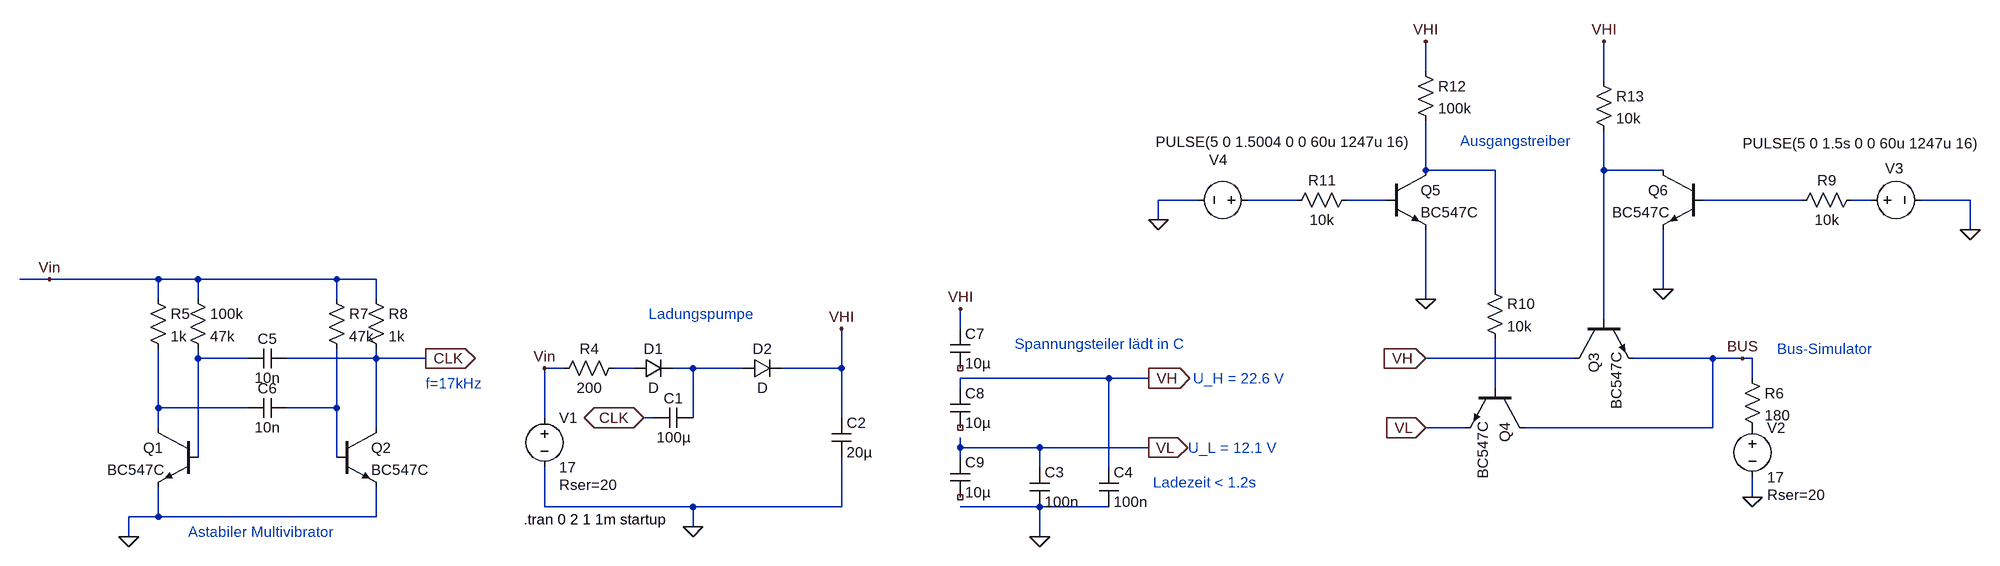
[diagram p0: schematic Drive2r.asc]
Drive2r.asc, the LTspice schematic file:
Version 4
SHEET 1 2516 820
WIRE 1456 -416 1456 -464
WIRE 1744 -400 1744 -464
WIRE 1456 -256 1456 -336
WIRE 1568 -256 1456 -256
WIRE 1744 -256 1744 -320
WIRE 1840 -256 1744 -256
WIRE 1088 -208 1024 -208
WIRE 1248 -208 1168 -208
WIRE 1392 -208 1328 -208
WIRE 2064 -208 1904 -208
WIRE 2176 -208 2144 -208
WIRE 2336 -208 2256 -208
WIRE 1024 -176 1024 -208
WIRE 2336 -160 2336 -208
WIRE -768 -80 -816 -80
WIRE -592 -80 -768 -80
WIRE -528 -80 -592 -80
WIRE -304 -80 -528 -80
WIRE -240 -80 -304 -80
WIRE 1568 -64 1568 -256
WIRE 1840 -64 1840 -160
WIRE -592 -48 -592 -80
WIRE -528 -48 -528 -80
WIRE -304 -48 -304 -80
WIRE -240 -48 -240 -80
WIRE 1456 -48 1456 -160
WIRE 1744 -16 1744 -256
WIRE 704 0 704 -32
WIRE -528 48 -528 32
WIRE -448 48 -528 48
WIRE -240 48 -240 32
WIRE -240 48 -384 48
WIRE -160 48 -240 48
WIRE 1696 48 1456 48
WIRE 1920 48 1792 48
WIRE 1968 48 1920 48
WIRE 1984 48 1968 48
WIRE 64 64 32 64
WIRE 176 64 144 64
WIRE 272 64 240 64
WIRE 352 64 272 64
WIRE 512 64 512 0
WIRE 512 64 416 64
WIRE 944 80 704 80
WIRE 1008 80 944 80
WIRE 1984 80 1984 48
WIRE 704 96 704 80
WIRE 1568 96 1568 16
WIRE -592 128 -592 32
WIRE -448 128 -592 128
WIRE -304 128 -304 32
WIRE -304 128 -384 128
WIRE 32 144 32 64
WIRE 208 144 192 144
WIRE 272 144 272 64
WIRE 512 144 512 64
WIRE -592 160 -592 128
WIRE -240 160 -240 48
WIRE 1520 160 1456 160
WIRE 1920 160 1920 48
WIRE 1920 160 1616 160
WIRE 704 192 704 176
WIRE 832 192 704 192
WIRE 1008 192 832 192
WIRE -528 208 -528 48
WIRE -304 208 -304 128
WIRE 704 208 704 192
WIRE 832 224 832 192
WIRE 944 224 944 80
WIRE 1984 272 1984 240
WIRE 32 288 32 224
WIRE 272 288 32 288
WIRE 512 288 512 208
WIRE 512 288 272 288
WIRE 832 288 704 288
WIRE 944 288 832 288
WIRE -592 304 -592 256
WIRE -592 304 -640 304
WIRE -240 304 -240 256
WIRE -240 304 -592 304
WIRE 272 320 272 288
WIRE -640 336 -640 304
WIRE 832 336 832 288
FLAG 272 320 0
FLAG 1008 80 VH
IOPIN 1008 80 Out
FLAG 1008 192 VL
IOPIN 1008 192 Out
FLAG 192 144 CLK
IOPIN 192 144 BiDir
FLAG -640 336 0
FLAG -768 -80 Vin
FLAG 32 64 Vin
FLAG -160 48 CLK
IOPIN -160 48 Out
FLAG 512 0 VHI
FLAG 832 336 0
FLAG 704 -32 VHI
FLAG 1984 272 0
FLAG 2336 -160 0
FLAG 1968 48 BUS
FLAG 1456 160 VL
IOPIN 1456 160 In
FLAG 1456 48 VH
IOPIN 1456 48 In
FLAG 1456 -464 VHI
FLAG 1024 -176 0
FLAG 1456 -48 0
FLAG 1744 -464 VHI
FLAG 1840 -64 0
SYMBOL voltage 32 128 R0
WINDOW 123 0 0 Left 0
WINDOW 39 24 124 Left 2
SYMATTR InstName V1
SYMATTR Value 17
SYMATTR SpiceLine Rser=20
SYMBOL diode 176 80 R270
WINDOW 0 32 32 VTop 2
WINDOW 3 0 32 VBottom 2
SYMATTR InstName D1
SYMBOL diode 352 80 R270
WINDOW 0 32 32 VTop 2
WINDOW 3 0 32 VBottom 2
SYMATTR InstName D2
SYMBOL cap 272 128 R90
WINDOW 0 0 32 VBottom 2
WINDOW 3 32 32 VTop 2
SYMATTR InstName C1
SYMATTR Value 100µ
SYMBOL cap 496 144 R0
SYMATTR InstName C2
SYMATTR Value 20µ
SYMBOL cap 816 224 R0
SYMATTR InstName C3
SYMATTR Value 100n
SYMBOL cap 928 224 R0
SYMATTR InstName C4
SYMATTR Value 100n
SYMBOL res 160 48 R90
WINDOW 0 0 56 VBottom 2
WINDOW 3 32 56 VTop 2
SYMATTR InstName R4
SYMATTR Value 200
SYMBOL res -608 -64 R0
SYMATTR InstName R5
SYMATTR Value 1k
SYMBOL res -256 -64 R0
SYMATTR InstName R8
SYMATTR Value 1k
SYMBOL npn -528 160 M0
SYMATTR InstName Q1
SYMATTR Value BC547C
SYMBOL npn -304 160 R0
SYMATTR InstName Q2
SYMATTR Value BC547C
SYMBOL res -544 -64 R0
SYMATTR InstName 100k
SYMATTR Value 47k
SYMBOL res -320 -64 R0
SYMATTR InstName R7
SYMATTR Value 47k
SYMBOL cap -384 32 R90
WINDOW 0 0 32 VBottom 2
WINDOW 3 32 32 VTop 2
SYMATTR InstName C5
SYMATTR Value 10n
SYMBOL cap -384 112 R90
WINDOW 0 0 32 VBottom 2
WINDOW 3 32 32 VTop 2
SYMATTR InstName C6
SYMATTR Value 10n
SYMBOL voltage 1984 144 R0
WINDOW 123 0 0 Left 0
WINDOW 39 24 124 Left 2
SYMATTR InstName V2
SYMATTR Value 17
SYMATTR SpiceLine Rser=20
SYMBOL res 1968 64 R0
SYMATTR InstName R6
SYMATTR Value 180
SYMBOL voltage 2160 -208 M90
WINDOW 0 -51 68 VLeft 2
WINDOW 3 -92 185 VLeft 2
WINDOW 123 0 0 Left 0
WINDOW 39 0 0 Left 0
SYMATTR InstName V3
SYMATTR Value PULSE(5 0 1.5s 0 0 60u 1247u 16)
SYMBOL npn 1696 -16 M90
SYMATTR InstName Q3
SYMATTR Value BC547C
SYMBOL res 2160 -224 R90
WINDOW 0 0 56 VBottom 2
WINDOW 3 32 56 VTop 2
SYMATTR InstName R9
SYMATTR Value 10k
SYMBOL voltage 1184 -208 M270
WINDOW 0 65 78 VLeft 2
WINDOW 3 94 164 VLeft 2
WINDOW 123 0 0 Left 0
WINDOW 39 0 0 Left 0
SYMATTR InstName V4
SYMATTR Value PULSE(5 0 1.5004 0 0 60u 1247u 16)
SYMBOL res 1552 -80 R0
SYMATTR InstName R10
SYMATTR Value 10k
SYMBOL npn 1616 96 R90
SYMATTR InstName Q4
SYMATTR Value BC547C
SYMBOL npn 1392 -256 R0
SYMATTR InstName Q5
SYMATTR Value BC547C
SYMBOL res 1344 -224 R90
WINDOW 0 0 56 VBottom 2
WINDOW 3 32 56 VTop 2
SYMATTR InstName R11
SYMATTR Value 10k
SYMBOL res 1440 -432 R0
SYMATTR InstName R12
SYMATTR Value 100k
SYMBOL npn 1904 -256 M0
SYMATTR InstName Q6
SYMATTR Value BC547C
SYMBOL res 1728 -416 R0
SYMATTR InstName R13
SYMATTR Value 10k
SYMBOL cap 688 0 R0
SYMATTR InstName C7
SYMATTR Value 10µ
SYMBOL cap 688 96 R0
SYMATTR InstName C8
SYMATTR Value 10µ
SYMBOL cap 688 208 R0
SYMATTR InstName C9
SYMATTR Value 10µ
TEXT -2 308 Left 2 !.tran 0 2 1 1m startup
TEXT -544 328 Left 2 ;Astabiler Multivibrator
TEXT 792 24 Left 2 ;Spannungsteiler lädt in C
TEXT 200 -24 Left 2 ;Ladungspumpe
TEXT -160 88 Left 2 ;f=17kHz
TEXT 1080 80 Left 2 ;U_H = 22.6 V
TEXT 1072 192 Left 2 ;U_L = 12.1 V
TEXT 1016 248 Left 2 ;Ladezeit < 1.2s
TEXT 2024 32 Left 2 ;Bus-Simulator
TEXT 1512 -304 Left 2 ;Ausgangstreiber

The netlist it stands for:
* Drive2r.asc
V1 Vin 0 17 Rser=20
D1 N008 N009 D
D2 N009 VHI D
C1 N009 CLK 100µ
C2 VHI 0 20µ
C3 VL 0 100n
C4 VH 0 100n
R4 N008 Vin 200
R5 Vin N011 1k
R8 Vin CLK 1k
Q1 N011 N007 0 0 BC547C
Q2 CLK N012 0 0 BC547C
R§100k Vin N007 47k
R7 Vin N012 47k
C5 CLK N007 10n
C6 N012 N011 10n
V2 P001 0 17 Rser=20
R6 BUS P001 180
V3 N006 0 PULSE(5 0 1.5s 0 0 60u 1247u 16)
Q3 VH N002 BUS 0 BC547C
R9 N006 N005 10k
V4 N003 0 PULSE(5 0 1.5004 0 0 60u 1247u 16)
R10 N001 N010 10k
Q4 BUS N010 VL 0 BC547C
Q5 N001 N004 0 0 BC547C
R11 N004 N003 10k
R12 VHI N001 100k
Q6 N002 N005 0 0 BC547C
R13 VHI N002 10k
C7 VHI NC_01 10µ
C8 VH NC_02 10µ
C9 VL NC_03 10µ
.model D D
.lib standard.dio
.model NPN NPN
.model PNP PNP
.lib standard.bjt
.tran 0 2 1 1m startup
* Astabiler Multivibrator
* Spannungsteiler lädt in C
* Ladungspumpe
* f=17kHz
* U_H = 22.6 V
* U_L = 12.1 V
* Ladezeit < 1.2s
* Bus-Simulator
* Ausgangstreiber
.backanno
.end